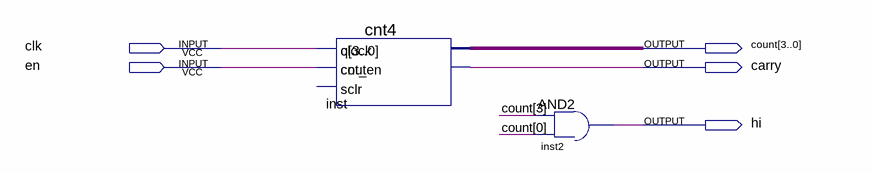
[diagram p0: schematic sheet]
// Quartus schematic top.bdf as structural Verilog: 2 symbols, 5 pins
module top (
  input  clk,
  input  en,
  output [3:0] count,
  output carry,
  output hi
);

  cnt4 inst (.clock(clk), .cnt_en(en), .q(count), .cout(carry));  // open: sclr
  and inst2 (hi, count[3], count[0]);
endmodule
